# Altium schematic sheet 7'' LCD Connector.SchDoc
size A4
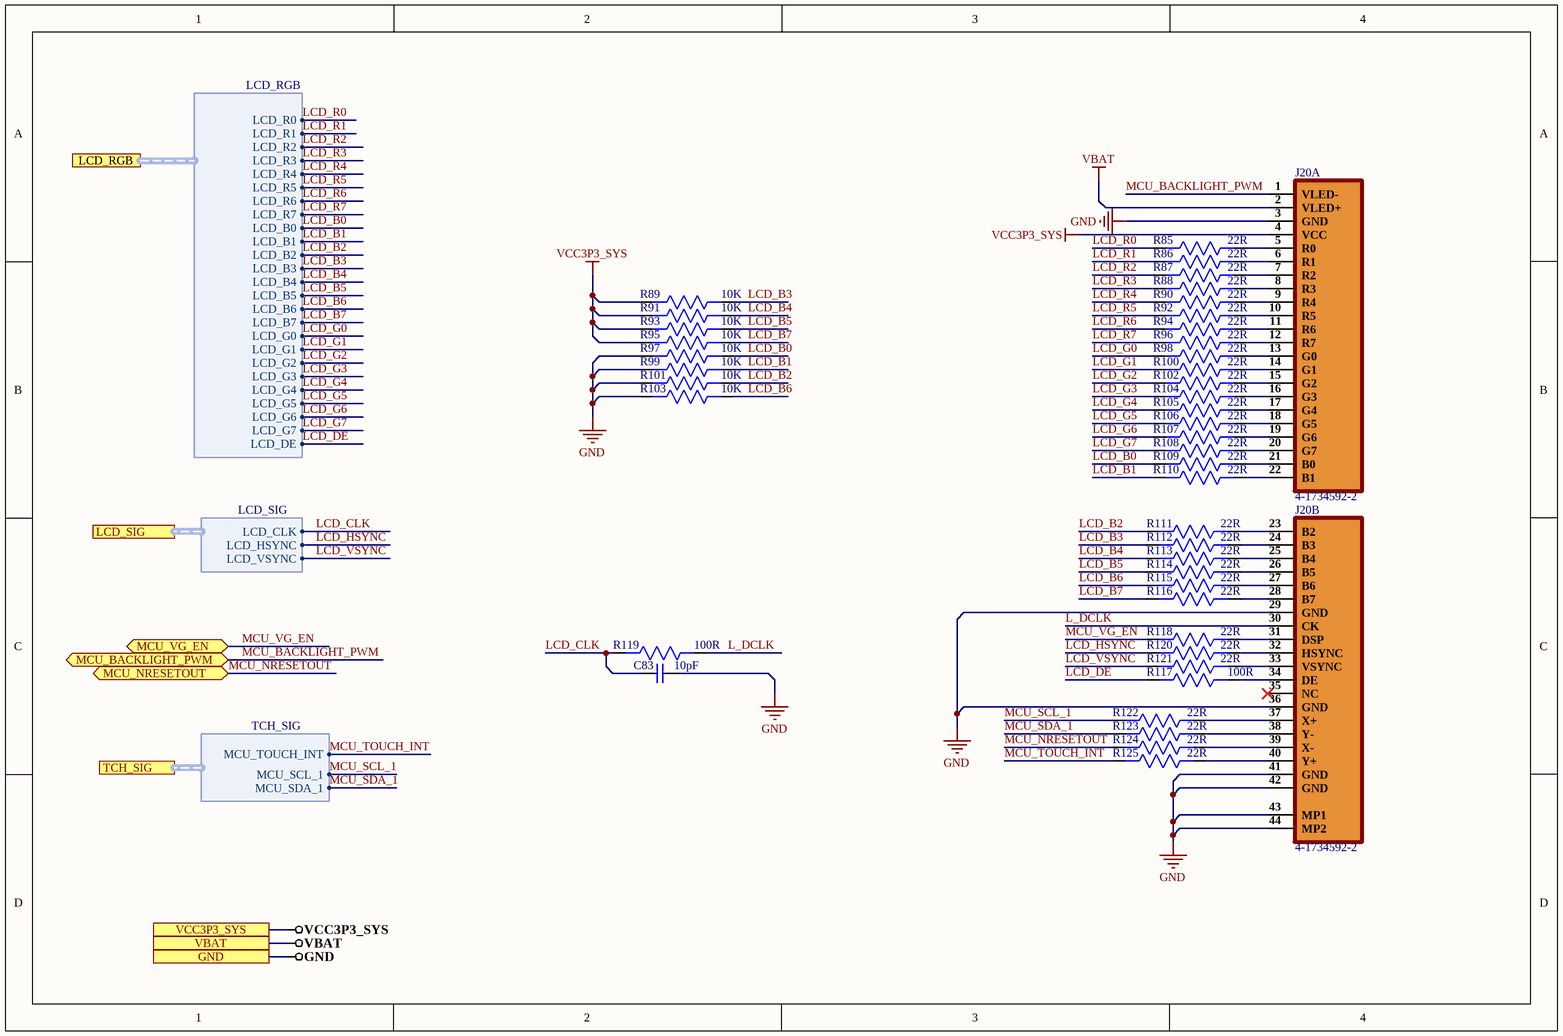
[diagram p0: 7'' LCD Connector.SchDoc]

## Parts
C83  10pF  [CAP 0201]
J20  4-1734592-2  [4-1734592-2]  (parts A,B of 2)
R85  22R  [Res-0201]
R86  22R  [Res-0201]
R87  22R  [Res-0201]
R88  22R  [Res-0201]
R89  10K  [Res-0201]
R90  22R  [Res-0201]
R91  10K  [Res-0201]
R92  22R  [Res-0201]
R93  10K  [Res-0201]
R94  22R  [Res-0201]
R95  10K  [Res-0201]
R96  22R  [Res-0201]
R97  10K  [Res-0201]
R98  22R  [Res-0201]
R99  10K  [Res-0201]
R100  22R  [Res-0201]
R101  10K  [Res-0201]
R102  22R  [Res-0201]
R103  10K  [Res-0201]
R104  22R  [Res-0201]
R105  22R  [Res-0201]
R106  22R  [Res-0201]
R107  22R  [Res-0201]
R108  22R  [Res-0201]
R109  22R  [Res-0201]
R110  22R  [Res-0201]
R111  22R  [Res-0201]
R112  22R  [Res-0201]
R113  22R  [Res-0201]
R114  22R  [Res-0201]
R115  22R  [Res-0201]
R116  22R  [Res-0201]
R117  100R  [Res-0201]
R118  22R  [Res-0201]
R119  100R  [Res-0201]
R120  22R  [Res-0201]
R121  22R  [Res-0201]
R122  22R  [Res-0201]
R123  22R  [Res-0201]
R124  22R  [Res-0201]
R125  22R  [Res-0201]

## Ports
GND, LCD_RGB (harness LCD_RGB), LCD_SIG (harness LCD_SIG), MCU_BACKLIGHT_PWM (bidir), MCU_NRESETOUT (bidir), MCU_VG_EN (bidir), TCH_SIG (harness TCH_SIG), VBAT, VCC3P3_SYS

## Harnesses
LCD_RGB: LCD_R0, LCD_R1, LCD_R2, LCD_R3, LCD_R5, LCD_R7, LCD_R6, LCD_R4, LCD_B0, LCD_B2, LCD_B4, LCD_B5, LCD_B6, LCD_B7, LCD_B3, LCD_B1, LCD_G0, LCD_G1, LCD_G2, LCD_G3, LCD_G4, LCD_G5, LCD_G6, LCD_G7, LCD_DE
TCH_SIG: MCU_TOUCH_INT, MCU_SCL_1, MCU_SDA_1
LCD_SIG: LCD_CLK, LCD_HSYNC, LCD_VSYNC

## Nets
GND: C83.2 J20.3(GND) J20.29(GND) J20.36(GND) J20.41(GND) J20.42(GND) J20.43(MP1) J20.44(MP2) R97.2 R99.2 R101.2 R103.2 ; port GND
VBAT: J20.2(VLED+) ; port VBAT
VCC3P3_SYS: J20.4(VCC) R89.2 R91.2 R93.2 R95.2 ; port VCC3P3_SYS
L_DCLK: J20.30(CK) R119.1
LCD_B0: R97.1 R109.2 ; port LCD_RGB.LCD_B0
LCD_B1: R99.1 R110.2 ; port LCD_RGB.LCD_B1
LCD_B2: R101.1 R111.2 ; port LCD_RGB.LCD_B2
LCD_B3: R89.1 R112.2 ; port LCD_RGB.LCD_B3
LCD_B4: R91.1 R113.2 ; port LCD_RGB.LCD_B4
LCD_B5: R93.1 R114.2 ; port LCD_RGB.LCD_B5
LCD_B6: R103.1 R115.2 ; port LCD_RGB.LCD_B6
LCD_B7: R95.1 R116.2 ; port LCD_RGB.LCD_B7
LCD_CLK: C83.1 R119.2 ; port LCD_SIG.LCD_CLK
LCD_DE: R117.2 ; port LCD_RGB.LCD_DE
LCD_G0: R98.2 ; port LCD_RGB.LCD_G0
LCD_G1: R100.2 ; port LCD_RGB.LCD_G1
LCD_G2: R102.2 ; port LCD_RGB.LCD_G2
LCD_G3: R104.2 ; port LCD_RGB.LCD_G3
LCD_G4: R105.2 ; port LCD_RGB.LCD_G4
LCD_G5: R106.2 ; port LCD_RGB.LCD_G5
LCD_G6: R107.2 ; port LCD_RGB.LCD_G6
LCD_G7: R108.2 ; port LCD_RGB.LCD_G7
LCD_HSYNC: R120.2 ; port LCD_SIG.LCD_HSYNC
LCD_R0: R85.2 ; port LCD_RGB.LCD_R0
LCD_R1: R86.2 ; port LCD_RGB.LCD_R1
LCD_R2: R87.2 ; port LCD_RGB.LCD_R2
LCD_R3: R88.2 ; port LCD_RGB.LCD_R3
LCD_R4: R90.2 ; port LCD_RGB.LCD_R4
LCD_R5: R92.2 ; port LCD_RGB.LCD_R5
LCD_R6: R94.2 ; port LCD_RGB.LCD_R6
LCD_R7: R96.2 ; port LCD_RGB.LCD_R7
LCD_VSYNC: R121.2 ; port LCD_SIG.LCD_VSYNC
MCU_BACKLIGHT_PWM: J20.1(VLED-) ; port MCU_BACKLIGHT_PWM
MCU_NRESETOUT: R124.2 ; port MCU_NRESETOUT
MCU_SCL_1: R122.2 ; port TCH_SIG.MCU_SCL_1
MCU_SDA_1: R123.2 ; port TCH_SIG.MCU_SDA_1
MCU_TOUCH_INT: R125.2 ; port TCH_SIG.MCU_TOUCH_INT
MCU_VG_EN: R118.2 ; port MCU_VG_EN
NetJ20_5: J20.5(R0) R85.1
NetJ20_6: J20.6(R1) R86.1
NetJ20_7: J20.7(R2) R87.1
NetJ20_8: J20.8(R3) R88.1
NetJ20_9: J20.9(R4) R90.1
NetJ20_10: J20.10(R5) R92.1
NetJ20_11: J20.11(R6) R94.1
NetJ20_12: J20.12(R7) R96.1
NetJ20_13: J20.13(G0) R98.1
NetJ20_14: J20.14(G1) R100.1
NetJ20_15: J20.15(G2) R102.1
NetJ20_16: J20.16(G3) R104.1
NetJ20_17: J20.17(G4) R105.1
NetJ20_18: J20.18(G5) R106.1
NetJ20_19: J20.19(G6) R107.1
NetJ20_20: J20.20(G7) R108.1
NetJ20_21: J20.21(B0) R109.1
NetJ20_22: J20.22(B1) R110.1
NetJ20_23: J20.23(B2) R111.1
NetJ20_24: J20.24(B3) R112.1
NetJ20_25: J20.25(B4) R113.1
NetJ20_26: J20.26(B5) R114.1
NetJ20_27: J20.27(B6) R115.1
NetJ20_28: J20.28(B7) R116.1
NetJ20_31: J20.31(DSP) R118.1
NetJ20_32: J20.32(HSYNC) R120.1
NetJ20_33: J20.33(VSYNC) R121.1
NetJ20_34: J20.34(DE) R117.1
NetJ20_37: J20.37(X+) R122.1
NetJ20_38: J20.38(Y-) R123.1
NetJ20_39: J20.39(X-) R124.1
NetJ20_40: J20.40(Y+) R125.1

Not connected (* = marked no-connect by the designer): J20 35(NC)*

## Library data of the parts
C83 = GRM0335C1H100FA01D: CAP CER 10PF 50V C0G/NP0 0201; Manufacturer: Murata; Tolerance: 1%; Dielectric: C0G; Supplier 1: Digi-Key; Manufacturer Part Number: GRM0335C1H100FA01D; RoHS: Yes; Category: Ceramic Capacitors; Stock 1: 317364; Pricing 1: 1=0.10000, 10=0.01900, 50=0.01060, 100=0.00860, 500=0.00616, 1000=0.00484, 2500=0.00440, 5000=0.00405 (USD); Mount: Surface Mount; Case/Package: 0201; Case Code (Metric): 0603; Case Code (Imperial): 0201; Min Operating Temperature: -55°C; Max Operating Temperature: 125°C; Termination: SMD/SMT; Package Quantity: 15000; Packaging: Tape and Reel; Capacitance: 10pF; Voltage Rating: 50V; Voltage Rating (DC): 50V; Length: 0.024inch; Width: 0.012inch; Height: 0.3mm; Thickness: 0.013inch; Lead Free: Lead Free; ComponentLink1URL: http://www.mouser.com/ds/2/281/c02e-2905.pdf?src-supplier=Mouser; ComponentLink1Description: http://www.mouser.com/ds/2/281/c02e-2905.pdf?src-supplier=Mouser; ComponentLink2URL: http://search.murata.co.jp/Ceramy/image/img/A01X/G101/ENG/GRM0335C1H100FA01-01.pdf?src-supplier=Digi-Key; ComponentLink2Description: http://search.murata.co.jp/Ceramy/image/img/A01X/G101/ENG/GRM0335C1H100FA01-01.pdf?src-supplier=Digi-Key; Supplier Part Number 1: 490-7750-1-ND
J20 = 4-1734592-2: CONN FPC BOTTOM 42POS 0.50MM R/A
R85-R88 R90 R92 R94 R96 R98 R100 R102 R104-R116 R118 R120-R125 = AC0201FR-0722RL: RES SMD 22 OHM 1% 1/20W 0201; Manufacturer: Yageo; Max Power Dissipation: 50mW; Temperature Coefficient: 200ppm/°C; Supplier 1: Digi-Key; Manufacturer Part Number: AC0201FR-0722RL; RoHS: Yes; Category: Chip SMD Resistors; Stock 1: 35550; Pricing 1: 1=0.10000, 10=0.06300, 100=0.02560, 1000=0.01149, 2500=0.00997, 5000=0.00823 (USD); Case/Package: 0201; Case Code (Metric): 0603; Case Code (Imperial): 0201; Min Operating Temperature: -55°C; Max Operating Temperature: 155°C; Packaging: Tape and Reel; Resistance: 22R; Resistor Type: Thick Film; Number of Terminations: 2; Tolerance: 1%; Features: Moisture Resistant,Automotive AEC-Q200; Length: 0.024inch; Width: 0.012inch; Height: 0.01inch; RoHS Compliant: Yes; ComponentLink1URL: http://www.yageo.com/NewPortal/yageodocoutput?fileName=/pdf/R-Chip/PYu-AC_51_RoHS_L_6.pdf&src-supplier=Digi-Key; ComponentLink1Description: http://www.yageo.com/NewPortal/yageodocoutput?fileName=/pdf/R-Chip/PYu-AC_51_RoHS_L_6.pdf&src-supplier=Digi-Key; Supplier Part Number 1: YAG3420CT-ND
R89 R91 R93 R95 R97 R99 R101 R103 = RC0201FR-0710KL: RES SMD 10K OHM 1% 1/20W 0201; Manufacturer: Yageo; Resistance: 10kR; Temperature Coefficient: 200ppm/°C; Power Rating: 50mW; Voltage Rating: 25V; Supplier 1: Digi-Key; Manufacturer Part Number: RC0201FR-0710KL; Stock 1: 12729696; Pricing 1: 1=0.1, 10=0.042, 100=0.0171, 1000=0.00768, 2500=0.00666, 5000=0.00551 (USD); Case/Package: 0201; Number of Pins: 2; Weight: 6E-06oz; Contact Plating: Tin,Matte; Case Code (Imperial): 0201; Case Code (Metric): 0603; Min Operating Temperature: -55°C; Max Operating Temperature: 125°C; Tolerance: 1%; Composition: Thick Film; Packaging: Tape and Reel; Package Quantity: 1; Termination: SMD/SMT; Number of Terminations: 2; Military Standard: Not; Max Power Dissipation: 50mW; Voltage Rating (DC): 25V; Working Voltage: 25V; Features: Moisture Resistant; Length: 0.6mm; Height: 0.01inch; Width: 0.3mm; Depth: 0.3mm; Radiation Hardening: No; REACH SVHC: No SVHC; Lead Free: Lead Free; ComponentLink1URL: http://www.yageo.com/documents/recent/PYu-RC_Group_51_RoHS_L_10.pdf?src-supplier=Digi-Key; ComponentLink1Description: http://www.yageo.com/documents/recent/PYu-RC_Group_51_RoHS_L_10.pdf?src-supplier=Digi-Key; ComponentLink2URL: http://www.farnell.com/datasheets/2167052.pdf?src-supplier=Element14; ComponentLink2Description: http://www.farnell.com/datasheets/2167052.pdf?src-supplier=Element14; ComponentLink3URL: http://www.yageo.com/documents/recent/PYu-RC0201_51_RoHS_L_8.pdf?src-supplier=Avnet; ComponentLink3Description: http://www.yageo.com/documents/recent/PYu-RC0201_51_RoHS_L_8.pdf?src-supplier=Avnet; ComponentLink4URL: http://www.yageo.com/documents/recent/PYu-RC0201_51_RoHS_L_8.pdf?src-supplier=Avnet+Europe; ComponentLink4Description: http://www.yageo.com/documents/recent/PYu-RC0201_51_RoHS_L_8.pdf?src-supplier=Avnet+Europe; ComponentLink5URL: https://www.verical.com/server-webapp/html/getDatasheet?partID=421074&src-supplier=Verical; ComponentLink5Description: https://www.verical.com/server-webapp/html/getDatasheet?partID=421074&src-supplier=Verical; ComponentLink6URL: http://www.farnell.com/datasheets/1421516.pdf?src-supplier=Element14; ComponentLink6Description: http://www.farnell.com/datasheets/1421516.pdf?src-supplier=Element14; Supplier Part Number 1: 311-10.0KMCT-ND
R117 R119 = AC0201FR-07100RL: RES SMD 100 OHM 1% 1/20W 0201; Manufacturer: Yageo; Max Power Dissipation: 50mW; Temperature Coefficient: 200ppm/°C; Supplier 1: Digi-Key; Manufacturer Part Number: AC0201FR-07100RL; RoHS: Yes; Category: Chip SMD Resistors; Stock 1: 124190; Pricing 1: 1=0.10000, 10=0.06300, 100=0.02560, 1000=0.01149, 2500=0.00997, 5000=0.00823 (USD); Case/Package: 0201; Case Code (Metric): 0603; Case Code (Imperial): 0201; Min Operating Temperature: -55°C; Max Operating Temperature: 155°C; Packaging: Tape and Reel; Resistance: 100R; Resistor Type: Thick Film; Number of Terminations: 2; Tolerance: 1%; Features: Moisture Resistant,Automotive AEC-Q200; Length: 0.024inch; Width: 0.012inch; Height: 0.01inch; RoHS Compliant: Yes; ComponentLink1URL: http://www.yageo.com/NewPortal/yageodocoutput?fileName=/pdf/R-Chip/PYu-AC_51_RoHS_L_6.pdf&src-supplier=Digi-Key; ComponentLink1Description: http://www.yageo.com/NewPortal/yageodocoutput?fileName=/pdf/R-Chip/PYu-AC_51_RoHS_L_6.pdf&src-supplier=Digi-Key; Supplier Part Number 1: YAG3412CT-ND